# Altium schematic sheet Encoders.SchDoc: Encoders
size A4; SheetNumber: 18; SheetTotal: 18
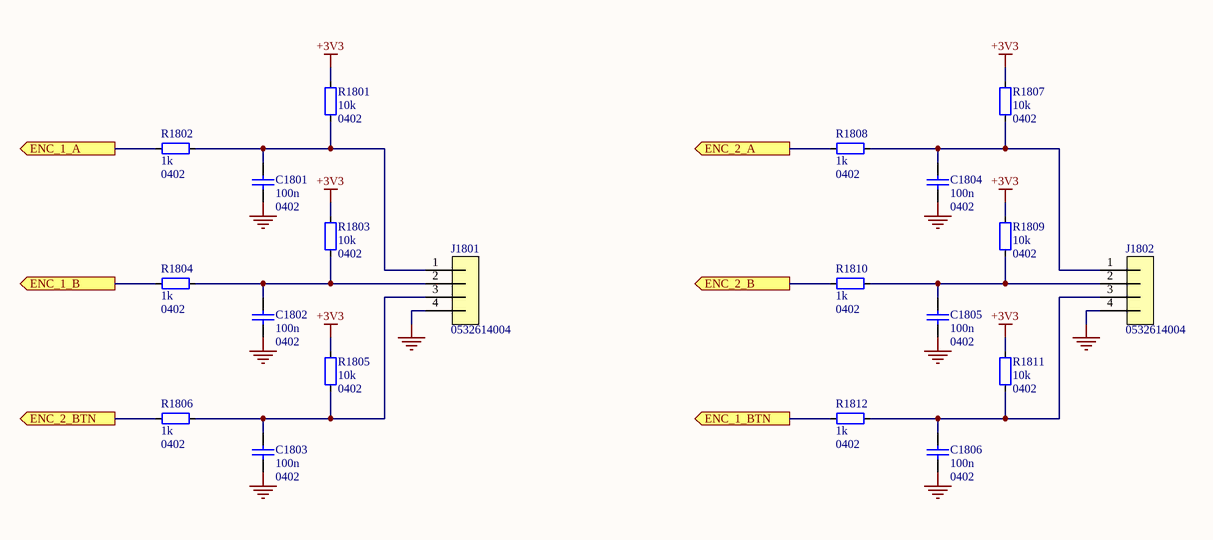
[diagram p0: Encoders.SchDoc]

## Parts
C1801  100n  Footprint: 0402  [CAP_0402_B]
C1802  100n  Footprint: 0402  [CAP_0402_B]
C1803  100n  Footprint: 0402  [CAP_0402_B]
C1804  100n  Footprint: 0402  [CAP_0402_B]
C1805  100n  Footprint: 0402  [CAP_0402_B]
C1806  100n  Footprint: 0402  [CAP_0402_B]
J1801  0532614004  [0532614004]
J1802  0532614004  [0532614004]
R1801  10k  Footprint: 0402  [RES_0402_A]
R1802  1k  Footprint: 0402  [RES_0402_A]
R1803  10k  Footprint: 0402  [RES_0402_A]
R1804  1k  Footprint: 0402  [RES_0402_A]
R1805  10k  Footprint: 0402  [RES_0402_A]
R1806  1k  Footprint: 0402  [RES_0402_A]
R1807  10k  Footprint: 0402  [RES_0402_A]
R1808  1k  Footprint: 0402  [RES_0402_A]
R1809  10k  Footprint: 0402  [RES_0402_A]
R1810  1k  Footprint: 0402  [RES_0402_A]
R1811  10k  Footprint: 0402  [RES_0402_A]
R1812  1k  Footprint: 0402  [RES_0402_A]

## Ports
ENC_1_A (out, see Top_Level[2A], MCU[2D]), ENC_1_B (out, see Top_Level[2A], MCU[2D]), ENC_1_BTN (out, see Top_Level[2A], MCU[2D]), ENC_2_A (out, see Top_Level[2A], MCU[2D]), ENC_2_B (out, see Top_Level[2A], MCU[2D]), ENC_2_BTN (out, see Top_Level[2A], MCU[2D])

## Nets
+3V3: R1801.1(a) R1803.1(a) R1805.1(a) R1807.1(a) R1809.1(a) R1811.1(a)
GND: C1801.2 C1802.2 C1803.2 C1804.2 C1805.2 C1806.2 J1801.4 J1802.4
ENC_1_A: R1802.1(a) ; port ENC_1_A
ENC_1_B: R1804.1(a) ; port ENC_1_B
ENC_1_BTN: R1812.1(a) ; port ENC_1_BTN
ENC_2_A: R1808.1(a) ; port ENC_2_A
ENC_2_B: R1810.1(a) ; port ENC_2_B
ENC_2_BTN: R1806.1(a) ; port ENC_2_BTN
NetC1801_1: C1801.1 J1801.1 R1801.2(a) R1802.2(a)
NetC1802_1: C1802.1 J1801.2 R1803.2(a) R1804.2(a)
NetC1803_1: C1803.1 J1801.3 R1805.2(a) R1806.2(a)
NetC1804_1: C1804.1 J1802.1 R1807.2(a) R1808.2(a)
NetC1805_1: C1805.1 J1802.2 R1809.2(a) R1810.2(a)
NetC1806_1: C1806.1 J1802.3 R1811.2(a) R1812.2(a)

## Library data of the parts
C1801-C1806 = CAP_0402: 0402 SMD Capacitor
J1801 J1802 = 0532614004: Connector Header Surface Mount, Right Angle 4 position 0.049" (1.25mm); Supplier 1: Arrow Electronics; Supplier Part Number 1: 0532614004
R1801-R1812 = RES_0402: 0402 SMD Resistor